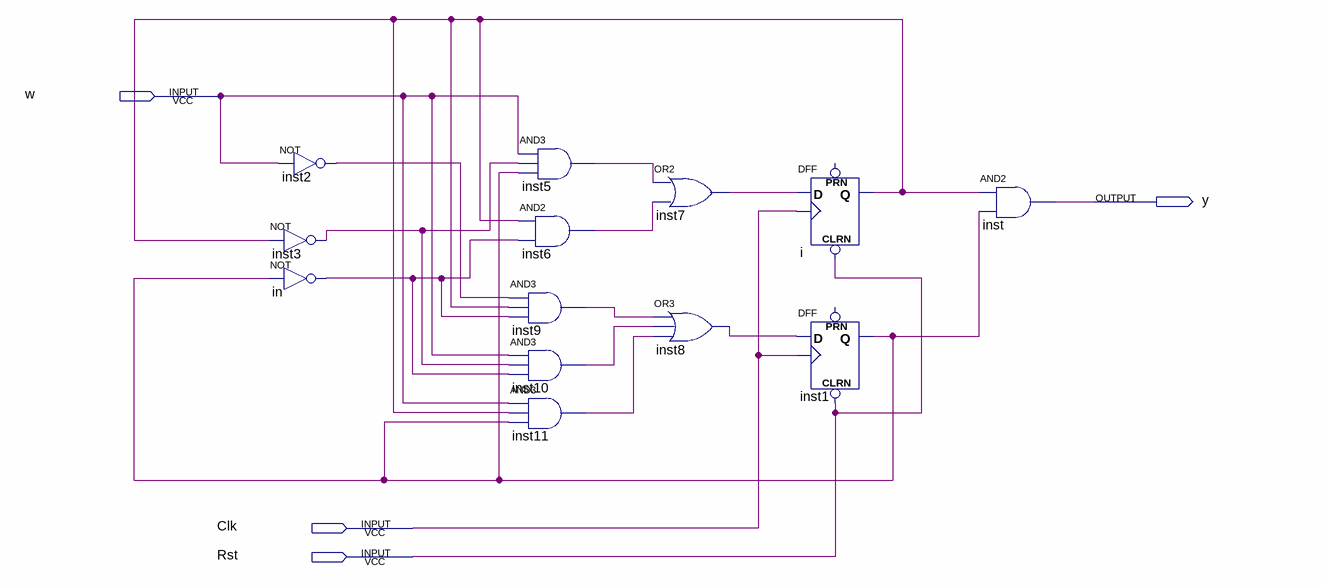
[diagram p0: schematic sheet]
// Quartus schematic MooreFSMDiagram1.bdf as structural Verilog: 13 symbols, 4 pins
module MooreFSMDiagram1 (
  input  w,
  input  Clk,
  input  Rst,
  output y
);

  wire i_q, in_out, inst1_q, inst2_out, inst3_out, inst5_out, inst6_out, inst7_out, inst8_out, inst9_out,
       inst10_out, inst11_out;

  not inst2 (inst2_out, w);
  not inst3 (inst3_out, i_q);
  not in (in_out, inst1_q);
  and inst5 (inst5_out, w, inst3_out, inst1_q);
  and inst6 (inst6_out, i_q, in_out);
  and inst9 (inst9_out, inst2_out, i_q, in_out);
  and inst10 (inst10_out, w, inst3_out, in_out);
  and inst11 (inst11_out, w, i_q, inst1_q);
  or inst7 (inst7_out, inst5_out, inst6_out);
  or inst8 (inst8_out, inst9_out, inst10_out, inst11_out);
  DFF i (.CLRN(Rst), .CLK(Clk), .D(inst7_out), .Q(i_q));  // open: PRN
  DFF inst1 (.CLRN(Rst), .CLK(Clk), .D(inst8_out), .Q(inst1_q));  // open: PRN
  and inst (y, i_q, inst1_q);
endmodule
